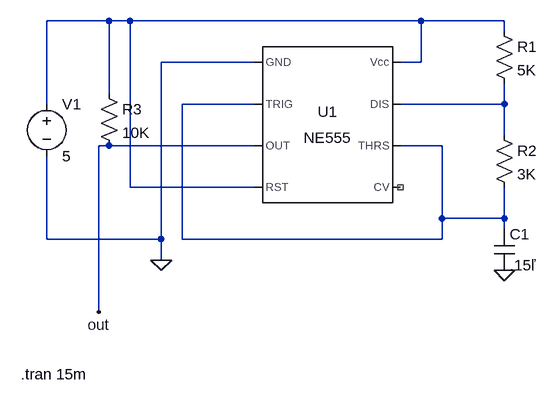
[diagram p0: schematic 555TimeSquareWave.asc]
555TimeSquareWave.asc, the LTspice schematic file:
Version 4.1
SHEET 1 880 680
WIRE -112 0 -208 0
WIRE -80 0 -112 0
WIRE 368 0 -80 0
WIRE 496 0 368 0
WIRE 496 16 496 0
WIRE 112 64 -32 64
WIRE 368 64 368 0
WIRE 368 64 336 64
WIRE -112 112 -112 0
WIRE -208 128 -208 0
WIRE 112 128 0 128
WIRE 496 128 496 96
WIRE 496 128 336 128
WIRE 496 176 496 128
WIRE -112 192 -128 192
WIRE 112 192 -112 192
WIRE 400 192 336 192
WIRE -80 256 -80 0
WIRE 112 256 -80 256
WIRE 400 304 400 192
WIRE 496 304 496 256
WIRE 496 304 400 304
WIRE 496 320 496 304
WIRE -208 336 -208 208
WIRE -32 336 -32 64
WIRE -32 336 -208 336
WIRE 0 336 0 128
WIRE 400 336 400 304
WIRE 400 336 0 336
WIRE -32 368 -32 336
WIRE -128 448 -128 192
FLAG -32 368 0
FLAG 496 384 0
FLAG -128 448 out
SYMBOL Misc\\NE555 224 160 R0
SYMATTR InstName U1
SYMBOL voltage -208 112 R0
WINDOW 123 0 0 Left 0
WINDOW 39 0 0 Left 0
SYMATTR InstName V1
SYMATTR Value 5
SYMBOL res 480 0 R0
SYMATTR InstName R1
SYMATTR Value 5K
SYMBOL res 480 160 R0
SYMATTR InstName R2
SYMATTR Value 3K
SYMBOL cap 480 320 R0
SYMATTR InstName C1
SYMATTR Value .15ľ
SYMBOL res -128 96 R0
SYMATTR InstName R3
SYMATTR Value 10K
TEXT -248 544 Left 2 !.tran 15m

The netlist it stands for:
* 555TimeSquareWave.asc
X§U1 0 N002 out N001 NC_01 N002 N003 N001 NE555  ; pins GND TRIG OUT RST CV THRS DIS Vcc
V1 N001 0 5
R1 N001 N003 5K
R2 N003 N002 3K
C1 N002 0 .15ľ
R3 N001 out 10K
.tran 15m
.lib NE555.sub
.backanno
.end